# EasyEDA Pro project ProPrj_小车整板_2026-04-26.epro

# Schematic Schematic1
Board Name: Board1; Create Date: 2025-11-21; Page Name: P1; Project Name: 小车整板; Schematic Name: Schematic1; Update Date: 2025-11-21; BladeWidth: 10; Company: 嘉立创EDA; Page Size: A4; RegionStart: 1; ShowBorder: 1; TitleBlock: 1; TitleBlockPosition: 3; Version: V1.0; XRegionCount: 6; YRegionCount: 4
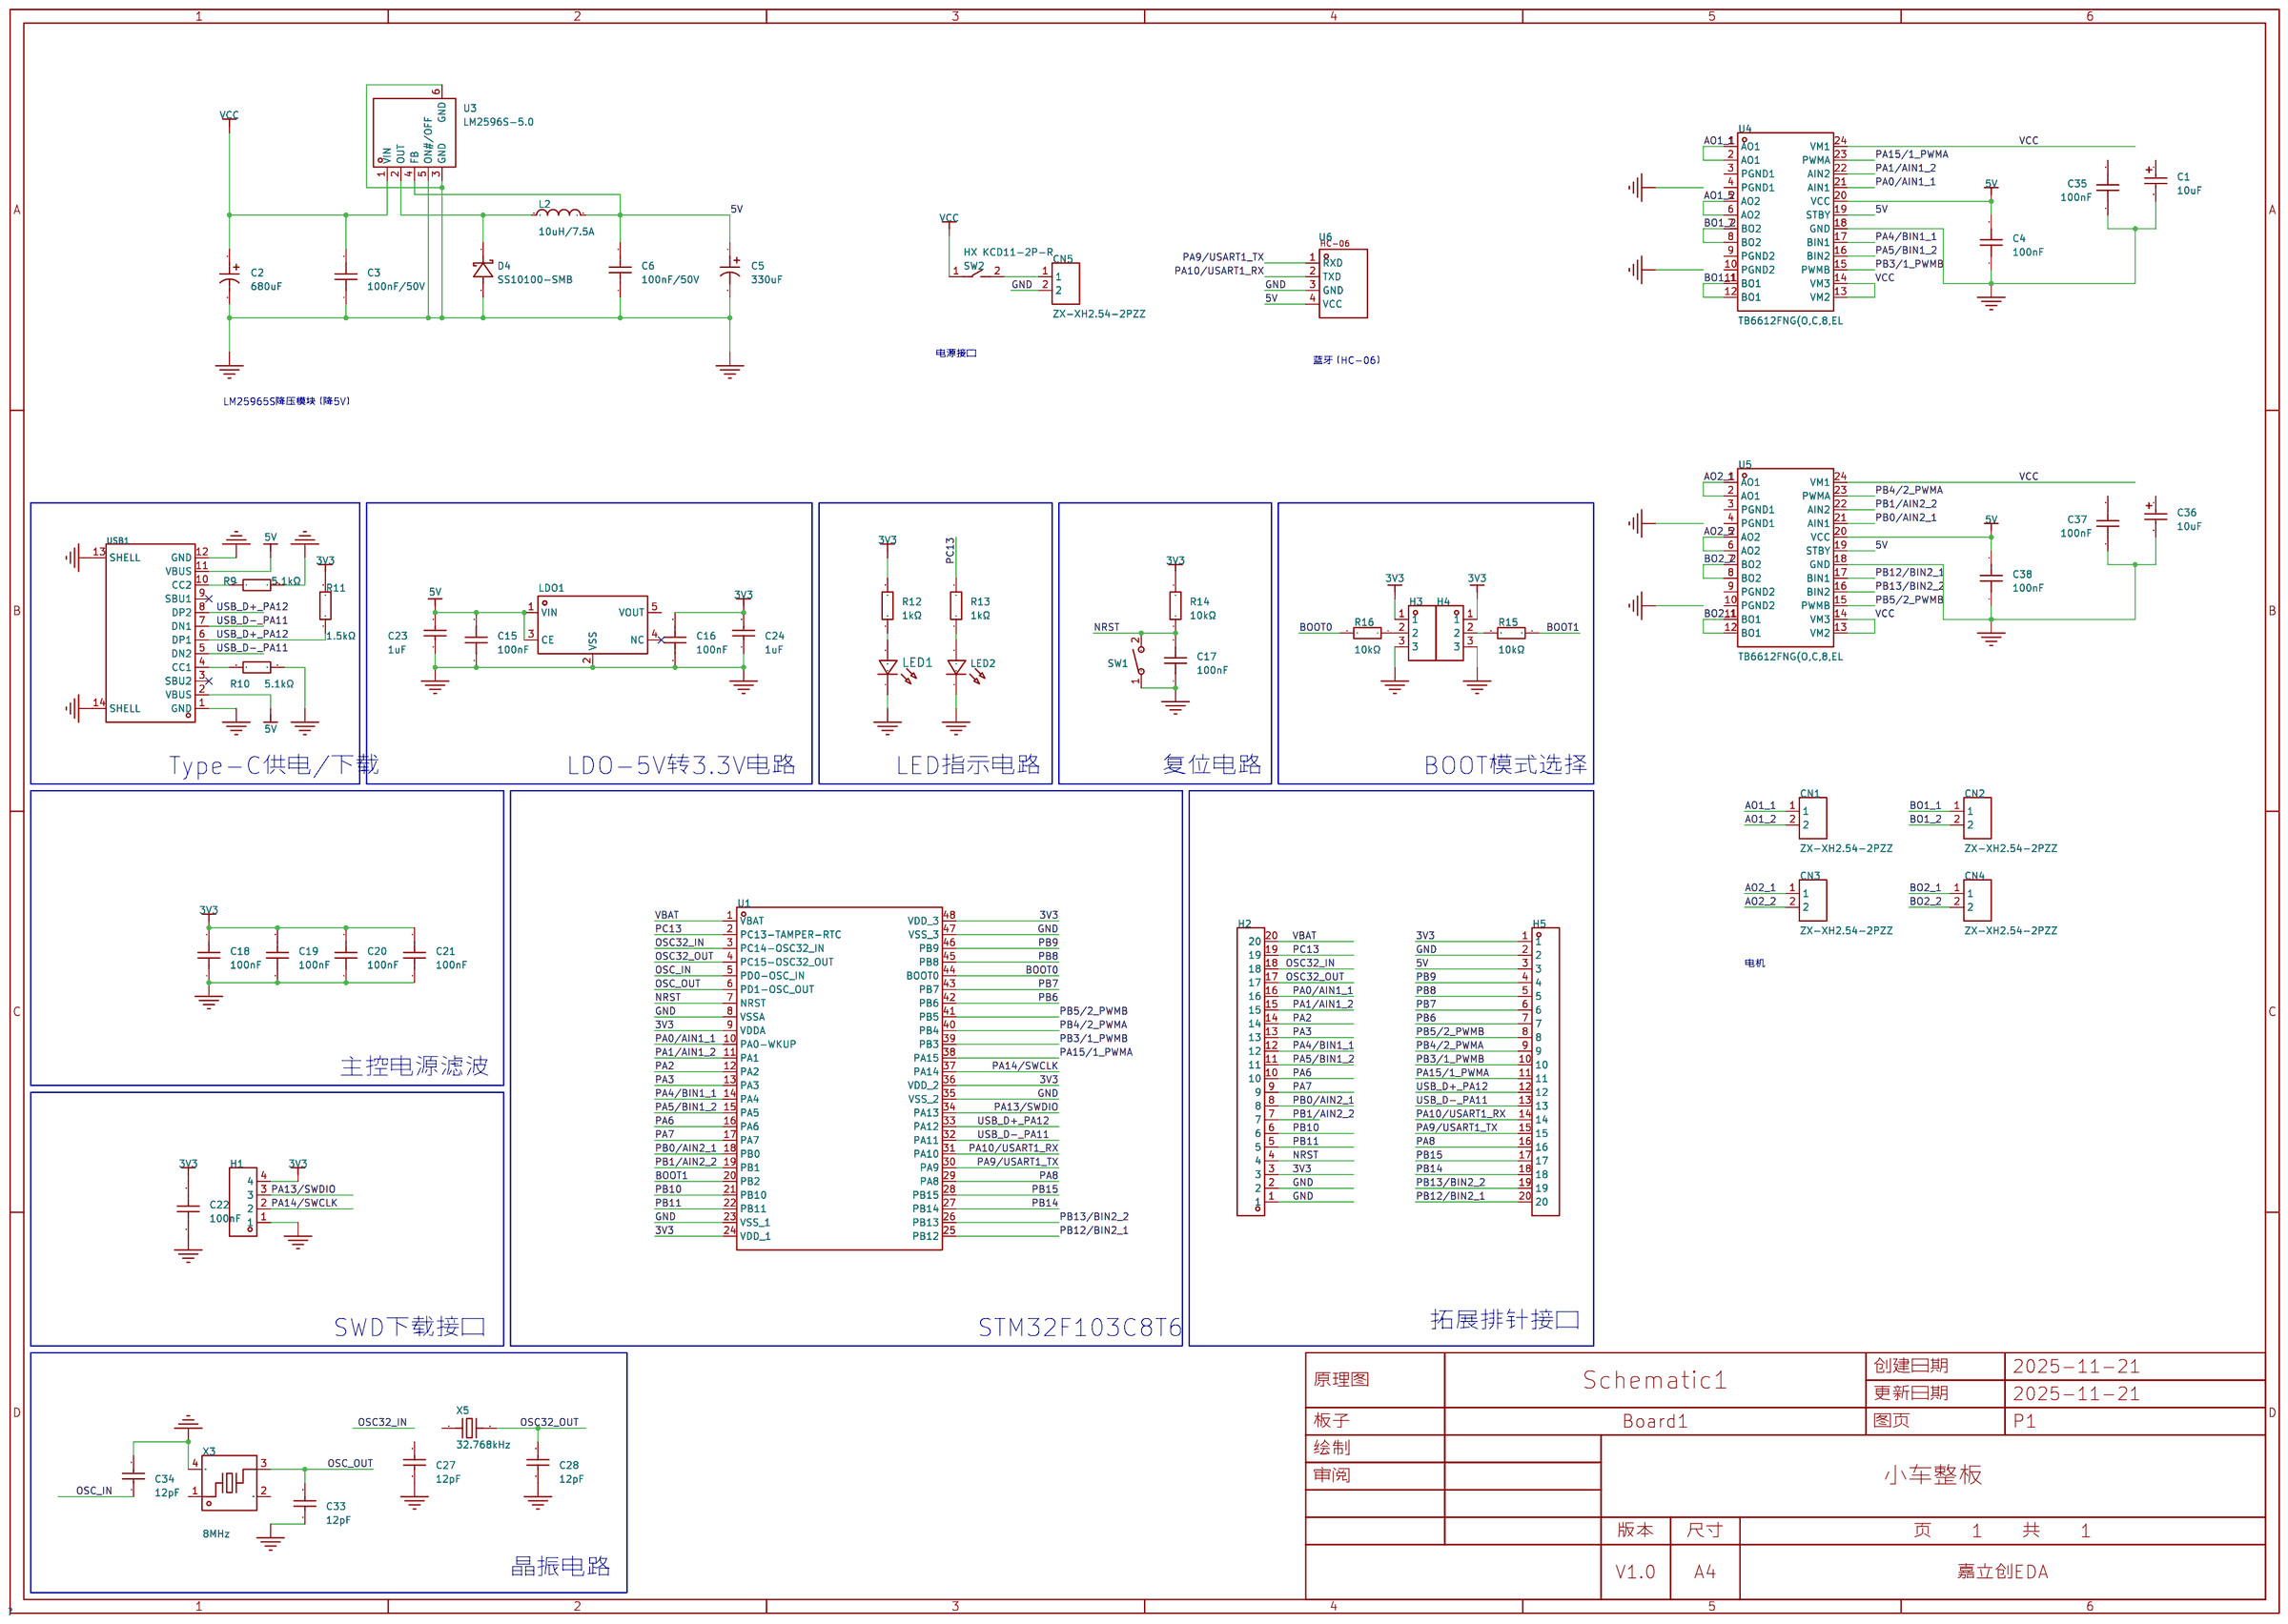
[diagram p0: schematic sheet]

## Parts
C1  10uF  [CAP-SMD_L3.2-W1.6-RD-C7171]
C2  680uF  [CAP-TH_BD13.0-P5.00-D0.6-FD]
C3  100nF/50V  [C0805]
C4  100nF  [C0603]
C5  330uF  [CAP-TH_BD8.0-P3.50-D0.6-FD]
C6  100nF/50V  [C0805]
C15  100nF  [R0402]
C16  100nF  [R0402]
C17  100nF  [R0402]
C18  100nF  [R0402]
C19  100nF  [R0402]
C20  100nF  [R0402]
C21  100nF  [R0402]
C22  100nF  [R0402]
C23  1uF  [R0402]
C24  1uF  [R0402]
C27  12pF  [R0402]
C28  12pF  [R0402]
C33  12pF  [R0402]
C34  12pF  [R0402]
C35  100nF  [C0603]
C36  10uF  [CAP-SMD_L3.2-W1.6-RD-C7171]
C37  100nF  [C0603]
C38  100nF  [C0603]
CN1  ZX-XH2.54-2PZZ  [CONN-TH_2P-P2.50_HX25003-2A]
CN2  ZX-XH2.54-2PZZ  [CONN-TH_2P-P2.50_HX25003-2A]
CN3  ZX-XH2.54-2PZZ  [CONN-TH_2P-P2.50_HX25003-2A]
CN4  ZX-XH2.54-2PZZ  [CONN-TH_2P-P2.50_HX25003-2A]
CN5  ZX-XH2.54-2PZZ  [CONN-TH_2P-P2.50_HX25003-2A]
D4  SS10100-SMB  [SMB_L4.6-W3.6-LS5.3-RD]
H1  -  [HDR-TH_4P-P2.54-V-M]
H2  -  [HDR-TH_20P-P2.54-V-M-1]
H3  -  [HDR-TH_3P-P2.54-V-M]
H4  -  [HDR-TH_3P-P2.54-V-M]
H5  -  [HDR-TH_20P-P2.54-V-M-1]
L2  10uH/7.5A  [IND-SMD_L11.0-W10.2]
LDO1  ME6211C33M5G-N  [SOT-23-5_L3.0-W1.7-P0.95-LS2.8-BL]
LED1  -  [LED_0603]
LED2  -  [LED_0603]
R9  5.1kΩ  [R0402]
R10  5.1kΩ  [R0402]
R11  1.5kΩ  [R0402]
R12  1kΩ  [R0402]
R13  1kΩ  [R0402]
R14  10kΩ  [R0402]
R15  10kΩ  [R0402]
R16  10kΩ  [R0402]
SW1  TS-1101-B-W  [KEY-SMD_2P-L6.0-W3.6-P7.4-LS8.0-L]
SW2  HX KCD11-2P-R  [SW-TH_2P-L15.0-W10.5-P5.00_KCD11-2P-R]
U1  STM32F103C8T6  [LQFP-48_L7.0-W7.0-P0.50-LS9.0-BL]
U3  LM2596S-5.0  [TO-263-5_L10.1-W8.7-P1.70-LS15.2-BR]
U4  TB6612FNG(O,C,8,EL  [SSOP-24_L8.4-W5.8-P0.65-LS7.8-BL]
U5  TB6612FNG(O,C,8,EL  [SSOP-24_L8.4-W5.8-P0.65-LS7.8-BL]
U6  -  [HC-06]
USB1  TYPE-C 16PIN 2MD(073)  [USB-C-SMD_TYPE-C-6PIN-2MD-073]
X3  8MHz  [CRYSTAL-SMD_4P-L3.2-W2.5-BL-1]
X5  32.768kHz  [OSC-SMD_L3.2-W1.5]

## Library data of the parts
C1 C36 = TAJA106K016RNJ: 容值:10uF;精度:±10%;额定电压:16V;等效串联电阻(ESR):3Ω@100kHz;; LCSC Part Name: 10uF ±10% 16V; Supplier Part: C7171; Manufacturer: Kyocera AVX; Supplier Footprint: CASE-A-3216-18(mm); JLCPCB Part Class: 基础库; Supplier: LCSC; Tolerance: ±10%; Voltage Rating: 16V; Equivalent Series Resistance(ESR): 3Ω@100kHz; Operating Temperature: -55℃~+125℃
C2 = ERG50V680M13X21: 容值:680uF;精度:±20%;额定电压:50V;纹波电流:2.18A@100kHz;等效串联电阻(ESR):30mΩ@100kHz;; LCSC Part Name: 680uF ±20% 50V; Supplier Part: C48935384; Manufacturer: 捷而瑞; Supplier Footprint: 插件,D13xL21mm; JLCPCB Part Class: 扩展库; Datasheet: https://atta.szlcsc.com/upload/public/pdf/source/20250526/717B4C76834FE5C4A331D19A222D031C.pdf; Supplier: LCSC; Tolerance: ±20%; Voltage Rating: 50V; Ripple Current: 2.18A@100kHz; Equivalent Series Resistance(ESR): 30mΩ@100kHz; Pin Spacing: 5mm; Diameter: 13mm; Height - Seated (Max): 21mm; Lifetime: 2000hrs@105℃; Operating Temperature: -40℃~+105℃
C3 C6 = CAP_0805: Supplier Footprint: 0805
C4 C35 C37 C38 = CGA0603X7R104K500JT: 容值:100nF;精度:±10%;额定电压:50V;温度系数:X7R;; LCSC Part Name: 100nF ±10% 50V; Supplier Part: C6119867; Manufacturer: HRE(芯声); Supplier Footprint: 0603; JLCPCB Part Class: 扩展库; Datasheet: https://atta.szlcsc.com/upload/public/pdf/source/20250103/C44077DA9E7B3EFAE02F22B6D3D1CBC9.pdf; Supplier: LCSC; Tolerance: ±10%; Voltage Rating: 50V; Temperature Coefficient: X7R
C5 = ERG25V330M8X12: 容值:330uF;精度:±20%;额定电压:25V;纹波电流:760mA@100kHz;等效串联电阻(ESR):87mΩ@100kHz;; LCSC Part Name: 330uF ±20% 25V; Supplier Part: C47344178; Manufacturer: 捷而瑞; Supplier Footprint: 插件,D8xL12mm; JLCPCB Part Class: 扩展库; Datasheet: https://atta.szlcsc.com/upload/public/pdf/source/20250526/717B4C76834FE5C4A331D19A222D031C.pdf; Supplier: LCSC; Tolerance: ±20%; Voltage Rating: 25V; Ripple Current: 760mA@100kHz; Equivalent Series Resistance(ESR): 87mΩ@100kHz; Pin Spacing: 3.5mm; Diameter: 8mm; Height - Seated (Max): 12mm; Lifetime: 2000hrs@105℃; Operating Temperature: -40℃~+105℃
C15-C22 = GRM155R71H104KE14D: LCSC Part Name: 100nF ±10% 50V; Supplier Part: C77020; Manufacturer: muRata(村田); Supplier Footprint: 0402; JLCPCB Part Class: 扩展库; Datasheet: https://atta.szlcsc.com/upload/public/pdf/source/20180326/C77020_39BD49C951FF1AF0DB1F1FAC5AC1E401.pdf; Supplier: LCSC; Tolerance: ±10%; Voltage Rated: 50V; Temperature Coefficient: X7R
C23 C24 = CL05A105KP5NNNC: LCSC Part Name: 1uF ±10% 10V; Supplier Part: C14445; Manufacturer: SAMSUNG(三星); Supplier Footprint: 0402; JLCPCB Part Class: 扩展库; Datasheet: https://atta.szlcsc.com/upload/public/pdf/source/20160218/1457707763339.pdf; Supplier: LCSC; Tolerance: ±10%; Voltage Rated: 10V; Temperature Coefficient: X5R
C27 C28 C33 C34 = 0402CG120J500NT: LCSC Part Name: 12pF ±5% 50V; Supplier Part: C1547; Manufacturer: FH(风华); Supplier Footprint: 0402; JLCPCB Part Class: 基础库; Datasheet: https://atta.szlcsc.com/upload/public/pdf/source/20200305/C486355_26A10D38EF8C2A5C37091D0039909270.pdf; Supplier: LCSC; Tolerance: ±5%; Voltage Rated: 50V; Temperature Coefficient: C0G
CN1-CN5 = ZX-XH2.54-2PZZ: 插针结构:1x2P;间距:2.5mm;安装方式:直插;参考系列:XH;总PIN数:2P;排数:1;每排PIN数:2;行距:-;额定电流:2A;触头材质:黄铜;触头镀层:锡;工作温度:-25℃~+85℃;; LCSC Part Name: 1x2P 间距:2.5mm 直插 系列:XH; Supplier Part: C7429632; Manufacturer: Megastar(兆星); Supplier Footprint: 插件,P=2.5mm; JLCPCB Part Class: Extended Part; Datasheet: https://item.szlcsc.com/datasheet/ZX-XH2.54-2PZZ/8427549.html; Supplier: LCSC; Pins Structure: 1x2P; Pitch: 2.5mm; Mounting Type: 直插; Reference Series: XH; Number of Pins: 2P; Number of Rows: 1; Number of PINs Per Row: 2; Current Rating: 2A; Contact Material: 黄铜; Contact Plating: 锡; Operating Temperature: -25℃~+85℃; Voltage Rating: 250V; Plastic Material: PA66; Flame Retardant Rating: UL94V-0; Color: 白色; Z-Height of the Board: 7mm; X-Length of Bottom Edge on Board (Spacing Line): 7.5mm; Y-Width of Bottom Edge on Board: 5.9mm
D4 = SS10100-SMB: 二极管配置:独立式;正向压降(Vf):850mV@10A;直流反向耐压(Vr):100V;整流电流:10A;; LCSC Part Name: 电压:100V 电流:10A; Supplier Part: C908688; Manufacturer: GOODWORK(固得沃克); Supplier Footprint: SMB(DO-214AA); JLCPCB Part Class: 扩展库; Datasheet: https://item.szlcsc.com/datasheet/SS10100-SMB/975440.html; Supplier: LCSC; Diode Configuration: 独立式; Voltage - Forward(Vf@If): 850mV@10A; Voltage - DC Reverse(Vr): 100V; Current - Rectified: 10A; Reverse Leakage Current (Ir): 20nA; Operating Junction Temperature Range: -55℃~+150℃
H1 = HDR-M_2.54_1x4P: Supplier Part: C2935929; Supplier Footprint: 插件
H2 H5 = HDR-M_2.54_1x20P: Supplier Part: C50981; Supplier Footprint: 插件
H3 H4 = HDR-M_2.54_1x3P: Supplier Part: C2937625; Supplier Footprint: 插件
L2 = SL1040-100M: 电感值:10uH;精度:±20%;额定电流:7.5A;饱和电流(Isat):8A;; LCSC Part Name: 10uH ±20% 8A; Supplier Part: C22463839; Manufacturer: 台湾陆海; Supplier Footprint: SMD,11x10.5mm; JLCPCB Part Class: 扩展库; Datasheet: https://atta.szlcsc.com/upload/public/pdf/source/20240611/8DE7D6BE1273F2E871C82A6D5C20B08D.pdf; Supplier: LCSC; Tolerance: ±20%; Current Rating: 7.5A; Current - Saturation (Isat): 8A
LDO1 = ME6211C33M5G-N: Supplier Part: C82942; Manufacturer: MICRONE(南京微盟); Supplier Footprint: SOT-23-5; JLCPCB Part Class: 扩展库; Datasheet: https://atta.szlcsc.com/upload/public/pdf/source/20170918/C82942_1505727073070976520.pdf; Supplier: LCSC; Output Type: 固定; Output Polarity: 正; Number of Outputs: 1; Maximum Input Voltage: 6V; Output Voltage: 3.3V; Dropout Voltage: 260mV@(200mA); Output Current: 500mA; Power Supply Rejection Ratio (PSRR): 70dB
LED1 = LED_0603-R: Supplier Footprint: 0603; Supplier Part: C84263
LED2 = LED_0603-B: Supplier Footprint: 0603; Supplier Part: C84266
R9 R10 = 0402WGF5101TCE: LCSC Part Name: 5.1kΩ ±1% 62.5mW 厚膜电阻; Supplier Part: C25905; Manufacturer: UNI-ROYAL(厚声); Supplier Footprint: 0402; JLCPCB Part Class: 基础库; Datasheet: https://atta.szlcsc.com/upload/public/pdf/source/20200306/C422600_1E6D84923E4A46A82E41ADD87F860B5C.pdf; Supplier: LCSC; Type: 厚膜电阻; Tolerance: ±1%; Power(Watts): 62.5mW; Overload Voltage (Max): 50V; Temperature Coefficient: ±100ppm/℃; Operating Temperature Range: -55℃~+155℃
R11 = 0402WGF1501TCE: LCSC Part Name: 1.5kΩ ±1% 62.5mW 厚膜电阻; Supplier Part: C25867; Manufacturer: UNI-ROYAL(厚声); Supplier Footprint: 0402; JLCPCB Part Class: 基础库; Datasheet: https://atta.szlcsc.com/upload/public/pdf/source/20200306/C422600_1E6D84923E4A46A82E41ADD87F860B5C.pdf; Supplier: LCSC; Type: 厚膜电阻; Tolerance: ±1%; Power(Watts): 62.5mW; Overload Voltage (Max): 50V; Temperature Coefficient: ±100ppm/℃; Operating Temperature Range: -55℃~+155℃
R12 R13 = 0402WGF1001TCE: LCSC Part Name: 1kΩ ±1% 62.5mW 厚膜电阻; Supplier Part: C11702; Manufacturer: UNI-ROYAL(厚声); Supplier Footprint: 0402; JLCPCB Part Class: 基础库; Datasheet: https://atta.szlcsc.com/upload/public/pdf/source/20200306/C422600_1E6D84923E4A46A82E41ADD87F860B5C.pdf; Supplier: LCSC; Type: 厚膜电阻; Tolerance: ±1%; Power(Watts): 62.5mW; Overload Voltage (Max): 50V; Temperature Coefficient: ±100ppm/℃; Operating Temperature Range: -55℃~+155℃
R14-R16 = RC0402FR-0710KL: LCSC Part Name: 厚膜电阻 10kΩ ±1% 62.5mW; Supplier Part: C60490; Manufacturer: YAGEO(国巨); Supplier Footprint: 0402; JLCPCB Part Class: 扩展库; Datasheet: https://atta.szlcsc.com/upload/public/pdf/source/20170925/C131467_1506321478108990263.pdf; Supplier: LCSC; Type: 厚膜电阻; Tolerance: ±1%; Power(Watts): 62.5mW; Overload Voltage (Max): 50V; Temperature Coefficient: ±100ppm/℃; Operating Temperature Range: -55℃~+155℃
SW1 = TS-1101-B-W_C500065: LCSC Part Name: 6*3.6*2.5mm 立贴 轻触开关; Supplier Part: C500065; Manufacturer: XKB Connectivity(中国星坤); Supplier Footprint: SMD; JLCPCB Part Class: 扩展库; Datasheet: https://atta.szlcsc.com/upload/public/pdf/source/20211011/D0E0CAF534F7B19DDE4CE68748A25BD3.pdf; Supplier: LCSC; Contact Current: 50mA; Voltage Rating (DC): 12V; Circuit: 单刀单掷; Mounting Style: 立贴; Actuator Style: 矩形按钮; Actuator/Cap Color: 白色; With Lamp: 无; Operating Force: 160gf; Mechanical Life: 5万次; Operating Temperature: -30℃~+85℃; Switch Length: 6mm; Switch Width: 3.6mm; Switch Height: 2.5mm; Strike Gundam: 否
SW2 = HX KCD11-2P-R: 带灯:无;引脚样式:焊片;额定电流:3A;额定电压(AC):250V;电路结构:单刀单掷;工作寿命:1万次;; LCSC Part Name: 10.5*15mm 两脚两档跷板开关 红钮; Supplier Part: C6917318; Manufacturer: hanxia(韩下); Supplier Footprint: 插件; JLCPCB Part Class: 扩展库; Datasheet: https://atta.szlcsc.com/upload/public/pdf/source/20230526/CAA555F1CB670B015E4FF3F7F6A5662A.pdf; Supplier: LCSC; With Lamp: 无; Termination Style: 焊片; Actuator Color: 红色; Current Rating: 3A; Voltage Rating (AC): 250V; Circuit: 单刀单掷; Life: 1万次
U1 = STM32F103C8T6: LCSC Part Name: STM32F103C8T6 MSL=3; Supplier Part: C8734; Manufacturer: ST(意法半导体); Supplier Footprint: LQFP-48(7x7); JLCPCB Part Class: 扩展库; Datasheet: https://atta.szlcsc.com/upload/public/pdf/source/20220812/8363ACEC51AD55ECEB84799464F7CB85.pdf; Supplier: LCSC; CPU Core: CM3; Program Storage Size: 64KB; RAM Size: 20KB; GPIO Ports Number: 37; Operating Voltage Range: 2V~3.6V; CPU Maximum Speed: 72MHz; Program Memory Type: FLASH; Operating Temperature Range: -40℃~+85℃; ADC (Bit): 12bit; Universal Serial Bus: 有; Peripheral/Function: 看门狗；DMA；看门狗；片载温度传感器; Watchdog: 有; Infrared Data Association: 有; Low-Voltage Detect: 有; Direct Memory Access: 有; Internal Oscillator: 有
U3 = LM2596S-5.0_C5276750: 功能类型:降压型;输出类型:固定;工作电压:-;输出电压:5V;输出电流:-;; LCSC Part Name: 3A降压电压调节器; Supplier Part: C5276750; Manufacturer: TWGMC(台湾迪嘉); Supplier Footprint: TO-263-5; JLCPCB Part Class: 扩展库; Datasheet: https://atta.szlcsc.com/upload/public/pdf/source/20221121/BE66229392871E6008E3503EDFD620B9.pdf; Supplier: LCSC; Function: 降压型; Output Type: 固定; Output Voltage: 5V; Switching Frequency: 150kHz; Operating Temperature: -40℃~+125℃; Number of Outputs: 1; Topology: 降压式
U4 U5 = TB6612FNG(O,C,8,EL: 双直流电机驱动器集成电路; Supplier Part: C88224; Manufacturer: TOSHIBA(东芝); Supplier Footprint: SSOP-24-208mil; JLCPCB Part Class: 扩展库; Datasheet: https://item.szlcsc.com/datasheet/TB6612FNG(O%252CC%252C8%252CEL/89402.html; Supplier: LCSC; RDS(on): 500mΩ; Peak Current: 3.2A; Operating Temperature: -20℃~+85℃
U6 = HC-06: 蓝牙模块-4P; _: 3
USB1 = TYPE-C 16PIN 2MD(073): LCSC Part Name: TYPE-C母座 16P 4脚插件带定位柱 不锈钢外壳 2次模顶; Supplier Part: C2765186; Manufacturer: SHOU HAN(首韩); Supplier Footprint: SMD; JLCPCB Part Class: 扩展库; Supplier: LCSC; Connector Type: Type-C; Gender: 母座; Number of Contacts: 16; Number of Ports: 1; Mounting Style: 卧贴; Current Rating - Power (Max): 5A; Operating Temperature Range: -25℃~+85℃
X3 = XL2EL89COI-111YLC-8M: LCSC Part Name: 8MHz ±10ppm 12pF; Supplier Part: C2973805; Manufacturer: YXC(扬兴晶振); Supplier Footprint: SMD3225-4P; JLCPCB Part Class: 扩展库; Datasheet: https://atta.szlcsc.com/upload/public/pdf/source/20240329/19D5F850207469550BEB00D7DFEDBC7A.pdf; Supplier: LCSC; Crystal Type: 贴片晶振; Normal temperature Frequency Tolerance: ±10ppm; External load capacitor: 12pF; Frequency Stability(Full temperature range): ±20ppm; Equivalent Series Resistance (ESR): 150Ω; Operating Temperature: -40℃~+85℃
X5 = X321532768KGD2SI: LCSC Part Name: 32.768kHz ±20ppm 12.5pF; Supplier Part: C620155; Manufacturer: YXC(扬兴晶振); Supplier Footprint: SMD3215-2P; JLCPCB Part Class: 扩展库; Datasheet: https://atta.szlcsc.com/upload/public/pdf/source/20240329/3A7650FD985DD0DE85694D3785AB4916.pdf; Supplier: LCSC; Crystal Type: 贴片晶振; Normal temperature Frequency Tolerance: ±20ppm; External load capacitor: 12.5pF; Operating Temperature: -40℃~+85℃

## Nets
3V3: C16.2 C18.2 C19.2 C20.2 C21.2 C22.2 C24.2 H1.4 H2.3 H3.1 H4.1 H5.1 LDO1.5(VOUT) R11.2 R12.2 R14.2 U1.9(VDDA) U1.24(VDD_1) U1.36(VDD_2) U1.48(VDD_3)
5V: C4.2 C5.1 C6.2 C15.2 C23.2 C38.2 H5.3 L2.2 LDO1.1(VIN) LDO1.3(CE) U3.4(FB) U4.19(STBY) U4.20(VCC) U5.19(STBY) U5.20(VCC) U6.4(VCC) USB1.2(VBUS) USB1.11(VBUS)
GND: C1.2 C2.2 C3.1 C4.1 C5.2 C6.1 C15.1 C16.1 C17.1 C18.1 C19.1 C20.1 C21.1 C22.1 C23.1 C24.1 C27.1 C28.1 C33.1 C34.2 C35.1 C36.2 C37.1 C38.1 CN5.2 D4.2(A) H1.1 H2.1 H2.2 H3.3 H4.3 H5.2 LDO1.2(VSS) LED1.1(C) LED2.1(C) R9.2 R10.2 SW1.1 U1.8(VSSA) U1.23(VSS_1) U1.35(VSS_2) U1.47(VSS_3) U3.3(GND) U3.5(ON#/OFF) U3.6(GND) U4.3(PGND1) U4.4(PGND1) U4.9(PGND2) U4.10(PGND2) U4.18(GND) U5.3(PGND1) U5.4(PGND1) U5.9(PGND2) U5.10(PGND2) U5.18(GND) U6.3(GND) USB1.1(GND) USB1.12(GND) USB1.13(SHELL) USB1.14(SHELL) X3.2(GND) X3.4(GND)
VBAT: H2.20 U1.1(VBAT)
VCC: C1.1 C2.1 C3.2 C35.2 C36.1 C37.2 SW2.1 U3.1(VIN) U4.13(VM2) U4.14(VM3) U4.24(VM1) U5.13(VM2) U5.14(VM3) U5.24(VM1)
AO1_1: CN1.1 U4.1(AO1) U4.2(AO1)
AO1_2: CN1.2 U4.5(AO2) U4.6(AO2)
AO2_1: CN3.1 U5.1(AO1) U5.2(AO1)
AO2_2: CN3.2 U5.5(AO2) U5.6(AO2)
BO1_1: CN2.1 U4.11(BO1) U4.12(BO1)
BO1_2: CN2.2 U4.7(BO2) U4.8(BO2)
BO2_1: CN4.1 U5.11(BO1) U5.12(BO1)
BO2_2: CN4.2 U5.7(BO2) U5.8(BO2)
BOOT0: R16.2 U1.44(BOOT0)
BOOT1: R15.1 U1.20(PB2)
NRST: C17.2 H2.4 R14.1 SW1.2 U1.7(NRST)
OSC32_IN: C27.2 H2.18 U1.3(PC14-OSC32_IN) X5.1
OSC32_OUT: C28.2 H2.17 U1.4(PC15-OSC32_OUT) X5.2
OSC_IN: C34.1 U1.5(PD0-OSC_IN) X3.1
OSC_OUT: C33.2 U1.6(PD1-OSC_OUT) X3.3
PA0/AIN1_1: H2.16 U1.10(PA0-WKUP) U4.21(AIN1)
PA1/AIN1_2: H2.15 U1.11(PA1) U4.22(AIN2)
PA2: H2.14 U1.12(PA2)
PA3: H2.13 U1.13(PA3)
PA4/BIN1_1: H2.12 U1.14(PA4) U4.17(BIN1)
PA5/BIN1_2: H2.11 U1.15(PA5) U4.16(BIN2)
PA6: H2.10 U1.16(PA6)
PA7: H2.9 U1.17(PA7)
PA8: H5.16 U1.29(PA8)
PA9/USART1_TX: H5.15 U1.30(PA9) U6.1(RXD)
PA10/USART1_RX: H5.14 U1.31(PA10) U6.2(TXD)
PA13/SWDIO: H1.3 U1.34(PA13)
PA14/SWCLK: H1.2 U1.37(PA14)
PA15/1_PWMA: H5.11 U1.38(PA15) U4.23(PWMA)
PB0/AIN2_1: H2.8 U1.18(PB0) U5.21(AIN1)
PB1/AIN2_2: H2.7 U1.19(PB1) U5.22(AIN2)
PB3/1_PWMB: H5.10 U1.39(PB3) U4.15(PWMB)
PB4/2_PWMA: H5.9 U1.40(PB4) U5.23(PWMA)
PB5/2_PWMB: H5.8 U1.41(PB5) U5.15(PWMB)
PB6: H5.7 U1.42(PB6)
PB7: H5.6 U1.43(PB7)
PB8: H5.5 U1.45(PB8)
PB9: H5.4 U1.46(PB9)
PB10: H2.6 U1.21(PB10)
PB11: H2.5 U1.22(PB11)
PB12/BIN2_1: H5.20 U1.25(PB12) U5.17(BIN1)
PB13/BIN2_2: H5.19 U1.26(PB13) U5.16(BIN2)
PB14: H5.18 U1.27(PB14)
PB15: H5.17 U1.28(PB15)
PC13: H2.19 R13.2 U1.2(PC13-TAMPER-RTC)
USB_D+_PA12: H5.12 R11.1 U1.33(PA12) USB1.6(DP1) USB1.8(DP2)
USB_D-_PA11: H5.13 U1.32(PA11) USB1.5(DN2) USB1.7(DN1)
$1N1914: R10.1 USB1.4(CC1)
$1N1923: R9.1 USB1.10(CC2)
$1N1934: LED1.2(A) R12.1
$1N1936: LED2.2(A) R13.1
$1N1947: H3.2 R16.1
$1N2133: H4.2 R15.2
$1N2477: D4.1(C) L2.1 U3.2(OUT)
$1N2684: CN5.1 SW2.2

Not connected (* = marked no-connect by the designer): LDO1 4(NC)*; USB1 3(SBU2)* 9(SBU1)*

## Notes on the sheet
- 电源接口
- 蓝牙（HC-06）
- LM25965S降压模块（降5V）
- Type-C供电/下载
- LDO-5V转3.3V电路
- LED指示电路
- 复位电路
- BOOT模式选择
- 电机
- 主控电源滤波
- SWD下载接口
- STM32F103C8T6
- 拓展排针接口
- 晶振电路

# Board PCB1
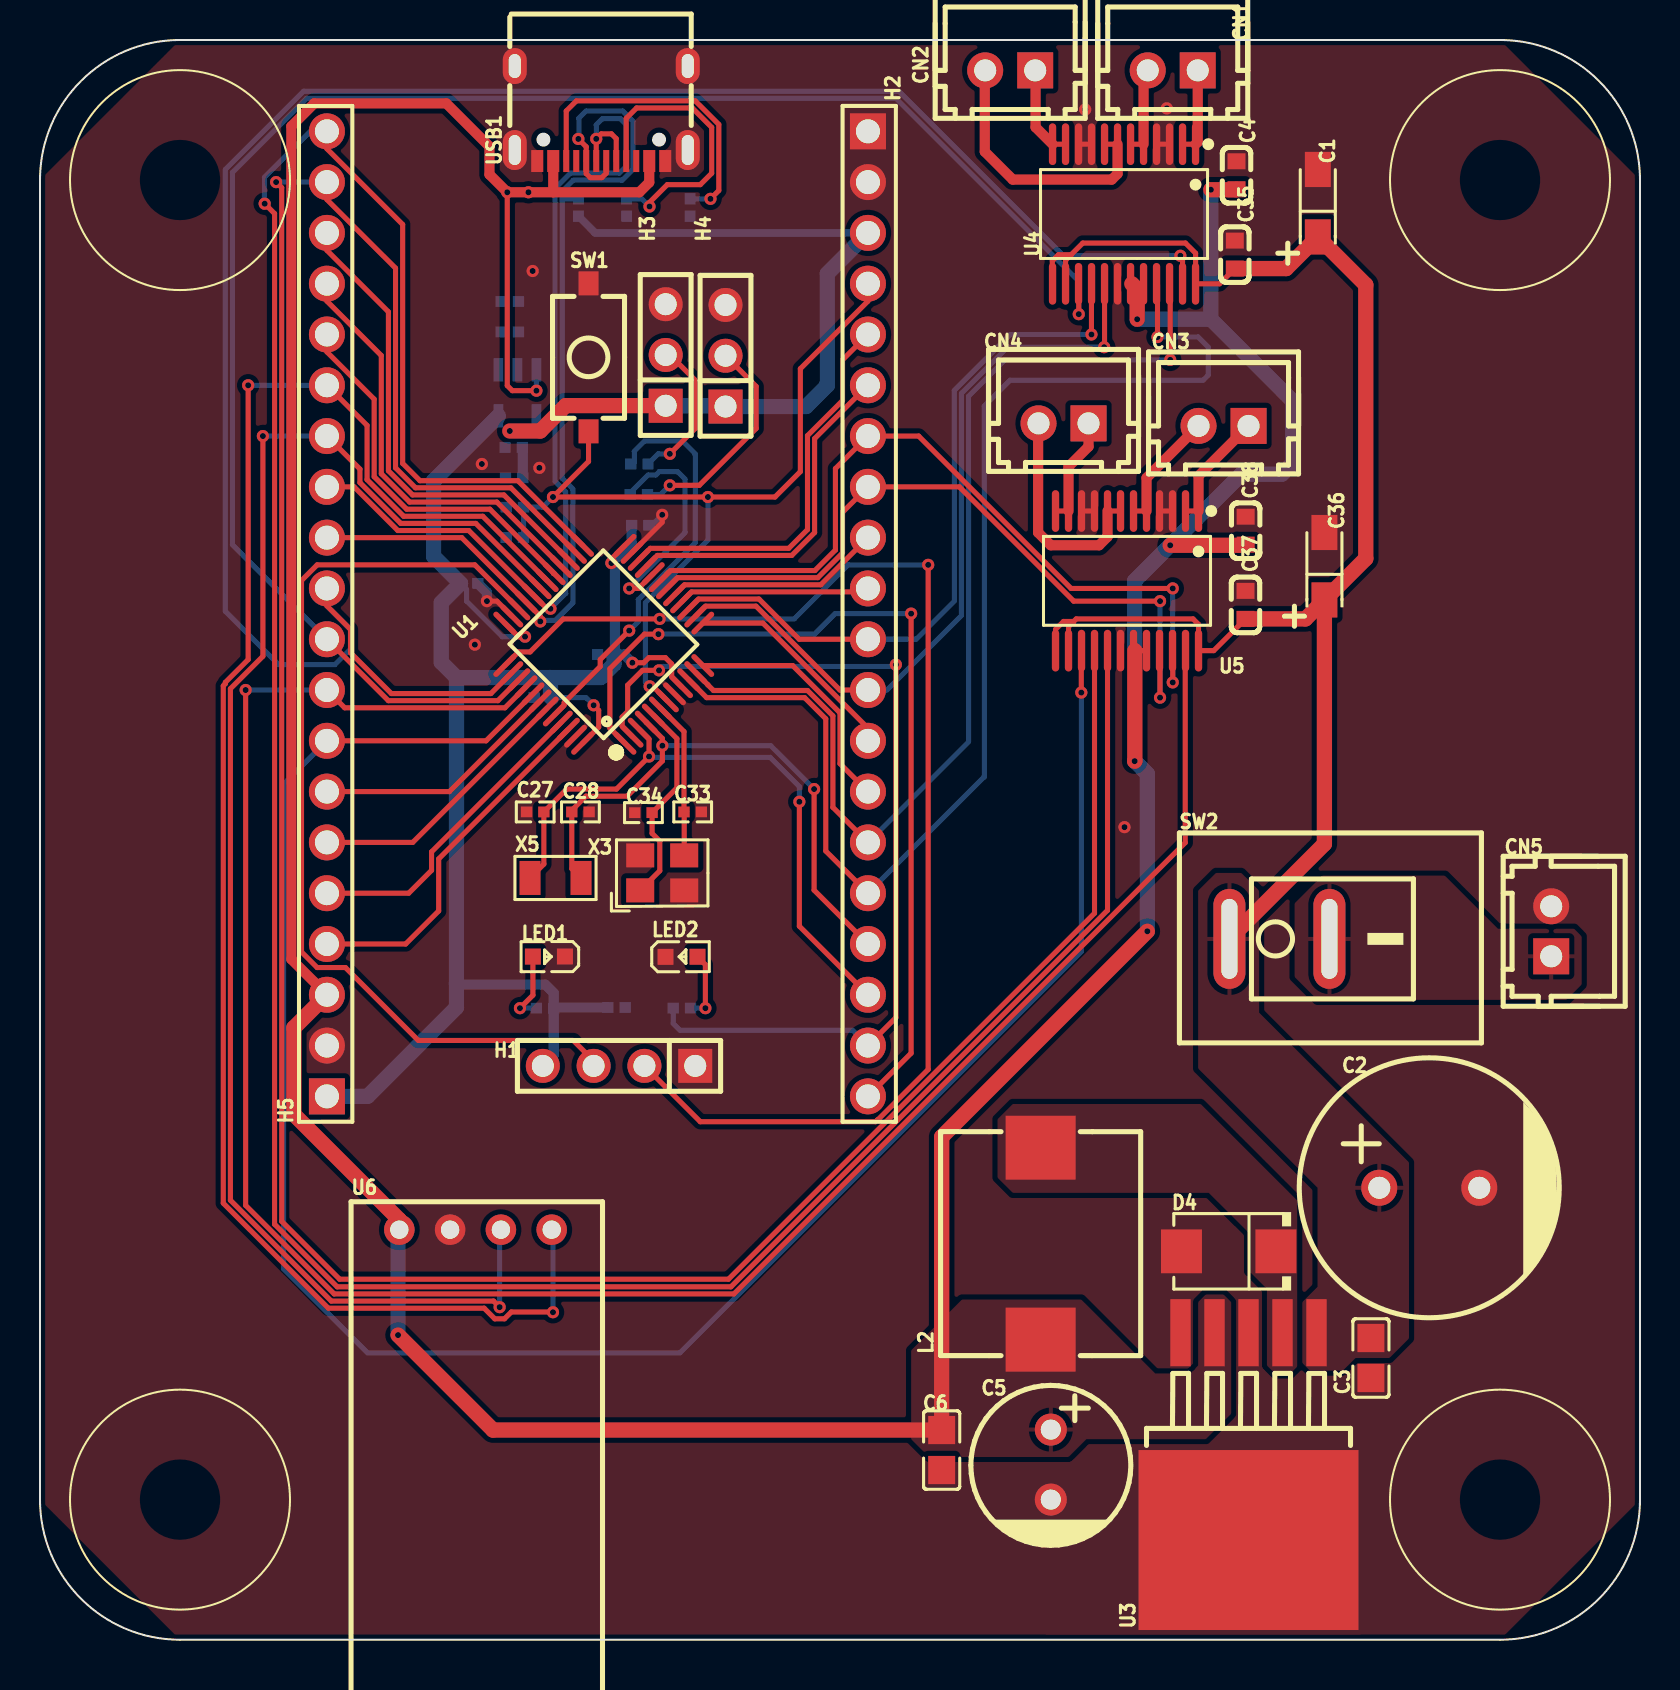
[diagram p1: board, top side]
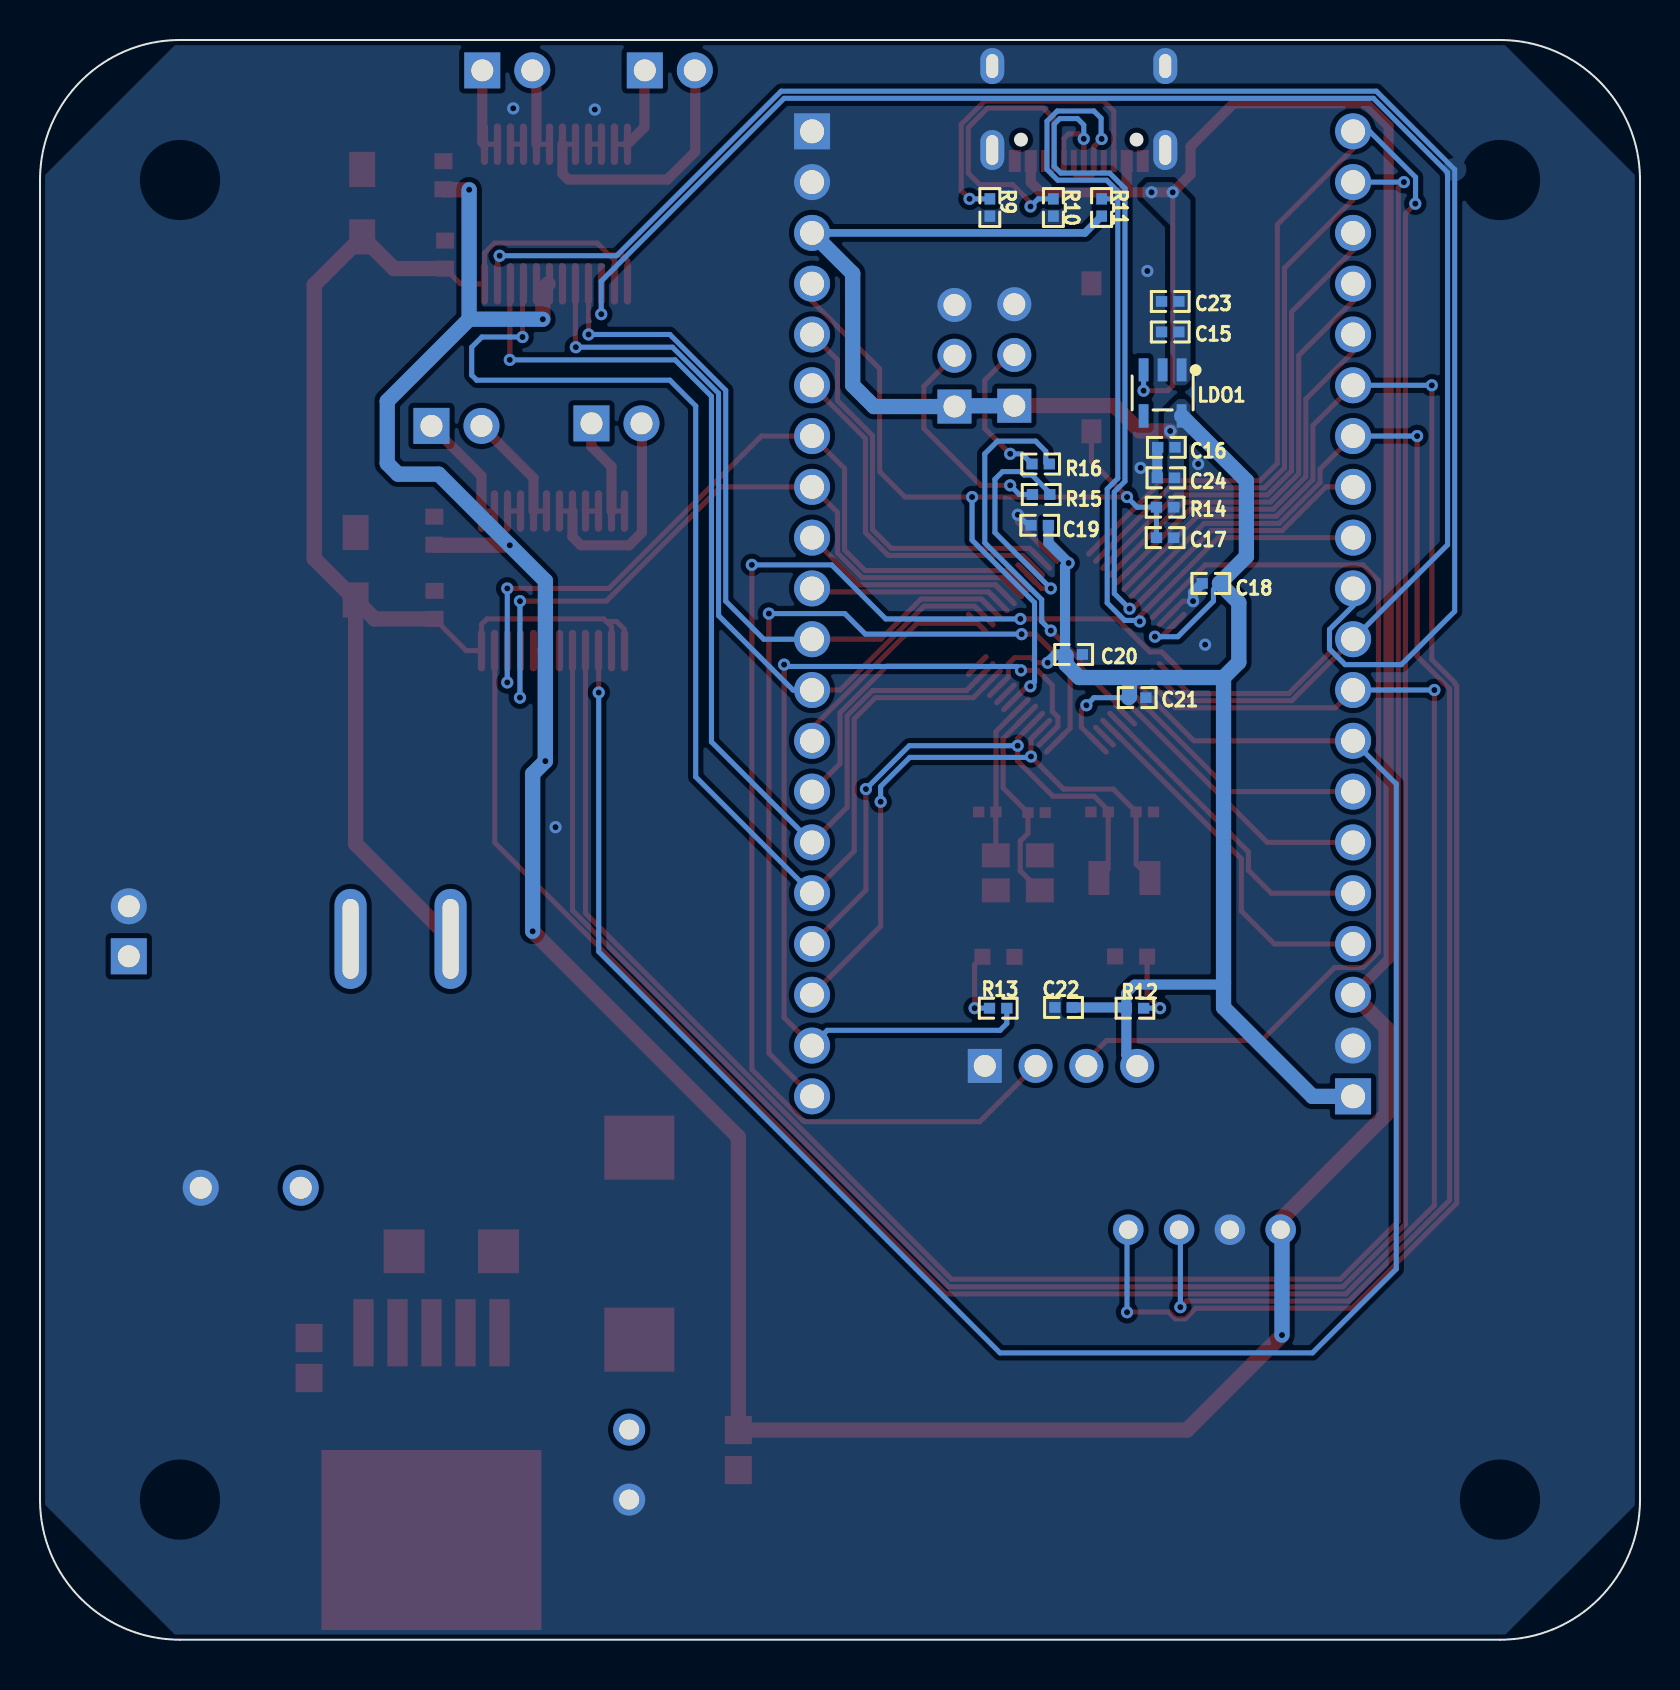
[diagram p2: board, bottom side, seen from below]

Outline 80 x 80 mm; copper layers: Top Layer, Bottom Layer. Coordinates in mm from the lower left corner of the outline.
Outline path: 0,73 arc(2.05,77.95) 7,80 73,80 arc(77.95,77.95) 80,73 80,7 arc(77.95,2.05) 73,0 7,0 arc(2.05,2.05) 0,7 0,73
Stack: Top Layer 0.035mm / Dielectric1 1.51mm FR4 er 4.5 / Bottom Layer 0.035mm

## Design rules (mm)
spacing copperThickness1oz (default): track to track 0.102, other pairs 0.152 to 0.3
spacing copperThickness2oz: track to track 0.203, other pairs 0.152 to 0.3
spacing Plane_innerPlane: track to track 0.102, other pairs 0.152 to 0.3
spacing Copper_copperRegion: track to track 0.102, other pairs 0.152 to 0.3
spacing Copper_copperRegion-gnd: track to track 0.102, other pairs 0.152 to 0.3
spacing Copper_copperRegion1: track to track 0.102, other pairs 0.152 to 0.3
track width copperThickness1oz (default): min 0.127, default 0.254, max 2.54
track width copperThickness2oz: min 0.203, default 0.254, max 2.54
differential pair differentialPair (default): width min 0.127, default 0.254, max 2.54; gap min 0.152, default 0.152
net VCC uses copperRegion1
net GND uses copperRegion-gnd
net 5V uses copperRegion1
net 3V3 uses copperRegion1
net $1N2477 uses copperRegion1
pour e734 uses Copper_copperRegion-gnd, copperRegion_Copper_copperRegion-gnd
pour e742 uses Copper_copperRegion-gnd, copperRegion_Copper_copperRegion-gnd
pour e746 uses Copper_copperRegion1, copperRegion_Copper_copperRegion1
pour e748 uses Copper_copperRegion1, copperRegion_Copper_copperRegion1
pour e750 uses Copper_copperRegion-gnd, copperRegion_Copper_copperRegion-gnd
pour e752 uses Copper_copperRegion1, copperRegion_Copper_copperRegion1
pour e758 uses Copper_copperRegion1, copperRegion_Copper_copperRegion1
pour e768 uses Copper_copperRegion1, copperRegion_Copper_copperRegion1
pour e770 uses Copper_copperRegion, copperRegion_Copper_copperRegion
pour e779 uses Copper_copperRegion-gnd, copperRegion_Copper_copperRegion-gnd
pour e781 uses Copper_copperRegion-gnd, copperRegion_Copper_copperRegion-gnd
pour e783 uses Copper_copperRegion-gnd, copperRegion_Copper_copperRegion-gnd

## Placement (name value [footprint] x y rotation side)
C1  10uF  [CAP-SMD_L3.2-W1.6-RD-C7171]  63.89 71.84 90 top
C2  680uF  [CAP-TH_BD13.0-P5.00-D0.6-FD]  69.46 22.6 0 top
C3  100nF/50V  [C0805]  66.55 14.09 90 top
C4  100nF  [C0603]  59.83 73.24 270 top
C5  330uF  [CAP-TH_BD8.0-P3.50-D0.6-FD]  50.54 8.76 270 top
C6  100nF/50V  [C0805]  45.08 9.49 90 top
C15  100nF  [R0402]  23.49 65.4 180 bottom
C16  100nF  [R0402]  23.68 59.63 180 bottom
C17  100nF  [R0402]  23.74 55.11 0 bottom
C18  100nF  [R0402]  21.46 52.83 180 bottom
C19  100nF  [R0402]  30.01 55.73 180 bottom
C20  100nF  [R0402]  28.32 49.27 0 bottom
C21  100nF  [R0402]  25.14 47.11 0 bottom
C22  100nF  [R0402]  28.82 31.62 180 bottom
C23  1uF  [R0402]  23.49 66.92 180 bottom
C24  1uF  [R0402]  23.7 58.1 180 bottom
C27  12pF  [R0402]  24.76 41.4 0 top
C28  12pF  [R0402]  27.02 41.4 180 top
C33  12pF  [R0402]  32.63 41.4 180 top
C34  12pF  [R0402]  30.17 41.36 180 top
C35  100nF  [C0603]  59.74 69.27 270 top
C36  10uF  [CAP-SMD_L3.2-W1.6-RD-C7171]  64.22 53.68 90 top
C37  100nF  [C0603]  60.28 51.75 270 top
C38  100nF  [C0603]  60.28 55.46 270 top
CN1  ZX-XH2.54-2PZZ  [CONN-TH_2P-P2.50_HX25003-2A]  56.64 78.48 180 top
CN2  ZX-XH2.54-2PZZ  [CONN-TH_2P-P2.50_HX25003-2A]  48.51 78.48 180 top
CN3  ZX-XH2.54-2PZZ  [CONN-TH_2P-P2.50_HX25003-2A]  59.18 60.7 180 top
CN4  ZX-XH2.54-2PZZ  [CONN-TH_2P-P2.50_HX25003-2A]  51.18 60.83 180 top
CN5  ZX-XH2.54-2PZZ  [CONN-TH_2P-P2.50_HX25003-2A]  75.56 35.43 90 top
D4  SS10100-SMB  [SMB_L4.6-W3.6-LS5.3-RD]  59.43 19.42 180 top
H1  -  [HDR-TH_4P-P2.54-V-M]  28.95 28.7 180 top
H2  -  [HDR-TH_20P-P2.54-V-M-1]  41.4 51.3 270 top
H3  -  [HDR-TH_3P-P2.54-V-M]  31.28 64.25 90 top
H4  -  [HDR-TH_3P-P2.54-V-M]  34.28 64.21 90 top
H5  -  [HDR-TH_20P-P2.54-V-M-1]  14.35 51.3 90 top
L2  10uH/7.5A  [IND-SMD_L11.0-W10.2]  50.03 19.81 270 top
LDO1  ME6211C33M5G-N  [SOT-23-5_L3.0-W1.7-P0.95-LS2.8-BL]  23.87 62.35 0 bottom
LED1  -  [LED_0603]  25.39 34.16 180 top
LED2  -  [LED_0603]  32.13 34.16 0 top
R9  5.1kΩ  [R0402]  32.51 71.62 270 bottom
R10  5.1kΩ  [R0402]  29.33 71.62 270 bottom
R11  1.5kΩ  [R0402]  26.92 71.62 270 bottom
R12  1kΩ  [R0402]  25.25 31.58 0 bottom
R13  1kΩ  [R0402]  32.09 31.58 180 bottom
R14  10kΩ  [R0402]  23.74 56.64 180 bottom
R15  10kΩ  [R0402]  29.94 57.27 0 bottom
R16  10kΩ  [R0402]  29.97 58.8 180 bottom
SW1  TS-1101-B-W  [KEY-SMD_2P-L6.0-W3.6-P7.4-LS8.0-L]  27.43 64.13 270 top
SW2  HX KCD11-2P-R  [SW-TH_2P-L15.0-W10.5-P5.00_KCD11-2P-R]  61.97 35.05 0 top
U1  STM32F103C8T6  [LQFP-48_L7.0-W7.0-P0.50-LS9.0-BL]  28.19 49.78 45 top
U3  LM2596S-5.0  [TO-263-5_L10.1-W8.7-P1.70-LS15.2-BR]  60.43 10.17 90 top
U4  TB6612FNG(O,C,8,EL  [SSOP-24_L8.4-W5.8-P0.65-LS7.8-BL]  54.2 71.3 180 top
U5  TB6612FNG(O,C,8,EL  [SSOP-24_L8.4-W5.8-P0.65-LS7.8-BL]  54.35 52.95 180 top
U6  -  [HC-06]  21.84 5.71 0 top
USB1  TYPE-C 16PIN 2MD(073)  [USB-C-SMD_TYPE-C-6PIN-2MD-073]  28.06 76.32 180 top
X3  8MHz  [CRYSTAL-SMD_4P-L3.2-W2.5-BL-1]  31.11 38.35 0 top
X5  32.768kHz  [OSC-SMD_L3.2-W1.5]  25.78 38.09 0 top

## Footprints (pads in the part's own frame, mm; a bottom-side part is the same pattern mirrored in y, then rotated)
C0603
  rect 0.8x0.9 smd: 1(-0.7,0) 2(0.7,0)
C0805
  rect 1.41x1.35 smd: 1(-1,0) 2(1,0)
CAP-SMD_L3.2-W1.6-RD-C7171
  rect 1.758x1.296 smd: 1(-1.687,0) 2(1.687,0)
CAP-TH_BD8.0-P3.50-D0.6-FD
  round 1.6 hole 1: 1(-1.75,0) 2(1.75,0)
CAP-TH_BD13.0-P5.00-D0.6-FD
  round 1.8 hole 1.1: 1(-2.5,0) 2(2.5,0)
CONN-TH_2P-P2.50_HX25003-2A
  rect 1.8x1.8 hole 1.1: 1(-1.25,0)
  round 1.8 hole 1.1: 2(1.25,0)
CRYSTAL-SMD_4P-L3.2-W2.5-BL-1
  rect 1.4x1.2 smd: 1(-1.1,-0.875) 2(1.1,-0.875) 3(1.1,0.875) 4(-1.1,0.875)
HC-06
  round 1.524 hole 0.914: 1(3.747,14.796) 2(1.206,14.796) 3(-1.333,14.796) 4(-3.873,14.796)
HDR-TH_3P-P2.54-V-M
  rect 1.7x1.7 hole 1.1: 1(-2.54,0)
  round 1.7 hole 1.1: 2(0,0) 3(2.54,0)
HDR-TH_4P-P2.54-V-M
  rect 1.7x1.7 hole 1.1: 1(-3.81,0)
  round 1.7 hole 1.1: 2(-1.27,0) 3(1.27,0) 4(3.81,0)
HDR-TH_20P-P2.54-V-M-1
  rect 1.8x1.8 hole 1.2: 1(-24.13,0)
  round 1.8 hole 1.2: 2(-21.59,0) 3(-19.05,0) 4(-16.51,0) 5(-13.97,0) 6(-11.43,0) 7(-8.89,0) 8(-6.35,0) 9(-3.81,0) 10(-1.27,0) 11(1.27,0) 12(3.81,0) 13(6.35,0) 14(8.89,0) 15(11.43,0) 16(13.97,0) 17(16.51,0) 18(19.05,0) 19(21.59,0) 20(24.13,0)
IND-SMD_L11.0-W10.2
  rect 3.2x3.5 smd: 1(-4.8,0) 2(4.8,0)
KEY-SMD_2P-L6.0-W3.6-P7.4-LS8.0-L
  rect 1.2x1 smd: 1(-3.7,0) 2(3.7,0)
LED_0603
  rect 0.8x0.8 smd: 1(-0.851,-0.01) 2(0.75,-0.005)
LQFP-48_L7.0-W7.0-P0.50-LS9.0-BL
  oval 0.27x1.5 smd: 1(-2.75,-4.25) 2(-2.25,-4.25) 3(-1.75,-4.25) 4(-1.25,-4.25) 5(-0.75,-4.25) 6(-0.25,-4.25) 7(0.25,-4.25) 8(0.75,-4.25) 9(1.25,-4.25) 10(1.75,-4.25) 11(2.25,-4.25) 12(2.75,-4.25) 25(2.75,4.25) 26(2.25,4.25) 27(1.75,4.25) 28(1.25,4.25) 29(0.75,4.25) 30(0.25,4.25) 31(-0.25,4.25) 32(-0.75,4.25) 33(-1.25,4.25) 34(-1.75,4.25) 35(-2.25,4.25) 36(-2.75,4.25)
  oval 1.5x0.27 smd: 13(4.25,-2.75) 14(4.25,-2.25) 15(4.25,-1.75) 16(4.25,-1.25) 17(4.25,-0.75) 18(4.25,-0.25) 19(4.25,0.25) 20(4.25,0.75) 21(4.25,1.25) 22(4.25,1.75) 23(4.25,2.25) 24(4.25,2.75) 37(-4.25,2.75) 38(-4.25,2.25) 39(-4.25,1.75) 40(-4.25,1.25) 41(-4.25,0.75) 42(-4.25,0.25) 43(-4.25,-0.25) 44(-4.25,-0.75) 45(-4.25,-1.25) 46(-4.25,-1.75) 47(-4.25,-2.25) 48(-4.25,-2.75)
OSC-SMD_L3.2-W1.5
  rect 1.05x1.7 smd: 1(-1.275,0) 2(1.275,0)
R0402
  rect 0.566x0.54 smd: 1(-0.433,0) 2(0.433,0)
SMB_L4.6-W3.6-LS5.3-RD
  rect 2.047x2.192 smd: 1(-2.361,0) 2(2.361,0)
SOT-23-5_L3.0-W1.7-P0.95-LS2.8-BL
  rect 0.49x1.157 smd: 1(-0.95,-1.153) 2(0,-1.153) 3(0.95,-1.153)
  rect 0.49x1.175 smd: 4(0.95,1.153) 5(-0.95,1.153)
SSOP-24_L8.4-W5.8-P0.65-LS7.8-BL
  oval 0.364x2.082 smd: 1(-3.575,-3.491) 2(-2.925,-3.491) 3(-2.275,-3.491) 4(-1.625,-3.491) 5(-0.975,-3.491) 6(-0.325,-3.491) 7(0.325,-3.491) 8(0.975,-3.491) 9(1.625,-3.491) 10(2.275,-3.491) 11(2.925,-3.491) 12(3.575,-3.491) 13(3.575,3.491) 14(2.925,3.491) 15(2.275,3.491) 16(1.625,3.491) 17(0.975,3.491) 18(0.325,3.491) 19(-0.325,3.491) 20(-0.975,3.491) 21(-1.625,3.491) 22(-2.275,3.491) 23(-2.925,3.491) 24(-3.575,3.491)
SW-TH_2P-L15.0-W10.5-P5.00_KCD11-2P-R
  oval 1.6x5 hole 0.8x4: 1(-2.5,0) 2(2.5,0)
TO-263-5_L10.1-W8.7-P1.70-LS15.2-BR
  rect 3.358x1.02 smd: 1(5.183,-3.4) 2(5.183,-1.7) 3(5.183,0) 4(5.183,1.7) 5(5.183,3.4)
  rect 9x11 smd: 6(-5.184,0)
USB-C-SMD_TYPE-C-6PIN-2MD-073
  rect 0.6x1.1 smd: 1(-3.2,2.375) 2(-2.4,2.375) 11(2.4,2.375) 12(3.2,2.375)
  rect 0.3x1.1 smd: 3(-1.75,2.375) 4(-1.25,2.375) 5(-0.75,2.375) 6(-0.25,2.375) 7(0.25,2.375) 8(0.75,2.375) 9(1.25,2.375) 10(1.75,2.375)
  oval 1.2x2 hole 0.6x1.5: 13(-4.325,1.825) 14(4.325,1.825)
  oval 1.2x1.8 hole 0.6x1.2: 13(-4.325,-2.375) 14(4.325,-2.375)

## Nets
As in the schematic.

Pads without a net: LDO1 4; USB1 3 9

## Via types
v1: diameter 0.61, hole 0.305, Top Layer to Bottom Layer, 66 vias

## Routing (per net, layer and track width the routed paths; a pad name or vN(x,y) marks a point on that pad's centre or on a via; arc(x,y) is an arc through that point)
3V3: length 125.3
  Top Layer w0.254: U1.48 27.94,45.64 27.94,46.48 v1(27.68,46.73) ; U1.36 23.92,50.16 v1(24.25,50.16) ; U1.9 31.58,48.15 31.58,48.8 31.27,49.11 30.44,49.11 30.19,48.86 v1(29.62,48.86) ; v1(28.57,53.84) 28.57,54.05 U1.24
  Top Layer w0.762: H3.1 31.28,61.72 26.28,61.72 25.01,60.45 v1(23.49,60.45)
  Bottom Layer w0.254: C21.2 27.3,47.11 v1(27.68,46.73) ; v1(24.25,50.16) 23.11,50.16 21.33,51.94 21.33,52.52 C18.2
  Bottom Layer w0.381: R11.2 27.76,70.35 H2.3
  Bottom Layer w0.508: 20.82,32.81 20.88,32.76 25.27,32.76 25.68,32.34 R12.2 ; H1.4 25.68,29.24 R12.2 ; C19.2 29.58,54.85 v1(28.57,53.84) 28.75,53.66 C20.2 29.2,49.27 v1(29.62,48.86) ; R12.2 25.72,31.62 C22.2
  Bottom Layer w0.762: C20.2 28.7,49.22 28.7,48.78 28.04,48.12 25.52,48.12 ; H5.1 16.38,27.17 20.82,31.62 20.82,48.12 ; H2.3 39.37,68.32 39.37,62.73 38.3,61.67 H4.1 34.24,61.71 H3.1 ; 20.82,48.12 25.52,48.12 ; 20.82,48.12 20.06,48.88 20.06,51.86 C18.2 19.68,54.17 19.68,57.96 LDO1.5 ; 25.52,48.12 25.52,47.16 C21.2
5V: length 219.5
  Top Layer w0.254: U4.20 U4.19 ; v1(24.82,62.46) 23.62,62.46 23.36,62.72 v1(23.36,72.39) ; U5.19 U5.20
  Top Layer w0.508: 25.66,72.39 USB1.11 ; 25.66,72.39 29.97,72.39 30.46,72.88 USB1.2 ; 25.66,72.39 v1(24.42,72.39) v1(23.36,72.39) 22.47,73.27 22.47,74.67 20.31,76.83 13.71,76.83 12.57,75.69 12.57,34.03 H5.3
  Top Layer w0.762: H5.3 12.69,30.6 12.69,26.27 17.97,21 U6.4 ; 54.59,67.81 54.86,67.54 v1(54.86,66.04) ; v1(54.73,43.94) 54.74,43.95 54.74,49.46 ; v1(17.9,15.24) 22.65,10.49 C6.2 45.08,25.14 v1(55.37,35.43) ; C4.2 59.8,72.51 v1(58.54,72.51) ; v1(56.51,54.73) 60.25,54.73 C38.2
  Bottom Layer w0.254: LDO1.3 24.82,62.48
  Bottom Layer w0.762: 58.54,66.04 62.64,61.94 62.64,58.83 62.1,58.29 60.07,58.29 v1(56.51,54.73) 54.73,52.95 v1(54.73,43.94) 55.37,43.3 v1(55.37,35.43) ; 58.54,66.04 v1(58.54,72.51) ; 58.54,66.04 v1(54.86,66.04) ; v1(17.9,15.24) 17.9,20.44 U6.4
GND: length 10.2
  Top Layer w0.254: U1.35 22.85,51.94 v1(22.35,51.94) ; v1(31.11,56.26) 31.11,55.88 U1.23 ; U4.4 U4.3 ; U5.10 U5.9 ; U4.9 U4.10 ; U5.4 U5.3
  Bottom Layer w0.254: 30.44,55.73 30.59,55.73 v1(31.11,56.26)
  Bottom Layer w0.508: C24.1 24.14,59.61 C16.1 ; C18.1 22.35,52.37 v1(22.35,51.94)
  vias: v1(21.74,49.76) v1(22.09,58.8) v1(24.63,68.45) v1(24.97,58.6) v1(52.26,76.52) v1(54.22,40.64) v1(56.34,76.58)
VBAT: length 45.3
  Top Layer w0.254: H2.20 43.56,29.33 v1(43.56,51.31) ; U1.1 28.49,45.59 28.49,48.56 30.22,50.29 v1(30.92,50.29)
  Bottom Layer w0.254: v1(30.92,50.29) 38.73,50.29 39.76,51.31 v1(43.56,51.31)
VCC: length 76.8
  Top Layer w0.254: C35.2 58.98,67.81 U4.24 57.78,67.81 57.78,69.34 57.27,69.84 52.14,69.84 51.56,69.26 ; 60.28,51.05 58.69,49.46 U5.24 57.93,50.78 57.65,51.05 51.81,51.05 51.68,50.92 ; 51.56,69.26 51.28,68.98 U4.14 ; 51.56,69.26 50.92,69.26 50.62,68.96 50.62,67.82 U4.13 ; 51.68,50.92 51.18,50.92 50.78,50.52 U5.13 ; 51.68,50.92 51.43,50.66 U5.14
  Top Layer w0.762: 60.28,51.05 63.27,51.05 64.22,52 ; 64.22,52 64.22,39.8 SW2.1 ; 64.22,52 66.29,54.07 66.29,67.75 C1.1 62.31,68.57 C35.2
AO1_1: length 4.4
  Top Layer w0.254: U4.2 U4.1
  Top Layer w0.508: U4.1 57.89,74.9 CN1.1
AO1_2: length 4.5
  Top Layer w0.254: U4.6 U4.5
  Top Layer w0.508: CN1.2 55.32,78.48 55.18,78.33 U4.5
AO2_1: length 5.9
  Top Layer w0.254: U5.2 U5.1
  Top Layer w0.508: U5.1 57.93,58.2 CN3.1
AO2_2: length 6
  Top Layer w0.254: U5.5 U5.6
  Top Layer w0.508: U5.5 55.33,58.1 CN3.2
BO1_1: length 4.7
  Top Layer w0.254: U4.11 U4.12
  Top Layer w0.508: U4.12 49.78,75.64 49.78,78.46 CN2.1
BO1_2: length 13.5
  Top Layer w0.254: U4.7 U4.8
  Top Layer w0.508: U4.7 53.88,73.31 53.59,73.02 48.64,73.02 47.24,74.42 47.24,78.46 CN2.2
BO2_1: length 5.4
  Top Layer w0.254: U5.12 U5.11
  Top Layer w0.508: CN4.1 52.43,59.67 51.43,58.67 U5.11
BO2_2: length 11.3
  Top Layer w0.254: U5.8 U5.7
  Top Layer w0.508: CN4.2 49.91,60.81 49.91,55.37 50.54,54.73 52.95,54.73 53.38,55.15 U5.8
BOOT0: length 20.3
  Top Layer w0.254: U1.44 26.21,46.74 26.21,46.87 28.01,48.67 28.01,49.02 v1(29.46,50.47)
  Bottom Layer w0.254: R16.2 29.66,58.8 29.71,58.85 29.71,59.43 30.22,59.94 32.13,59.94 32.76,59.3 32.76,54.86 29.92,52.01 29.92,50.92 v1(29.46,50.47)
BOOT1: length 11.6
  Top Layer w0.254: U1.20 29.92,52.57 v1(29.46,52.57)
  Bottom Layer w0.254: v1(29.46,52.57) 32.25,55.37 32.25,58.03 31.87,58.42 30.97,58.42 30.8,58.25 30.4,58.25 29.51,57.35 29.51,57.27
NRST: length 43
  Top Layer w0.254: H2.4 41.4,66.94 38.02,63.56 38.02,58.42 36.75,57.15 v1(33.4,57.15) v1(25.65,57.15) 27.43,58.92 SW1.2 ; v1(30.48,47.68) 30.64,47.68 31.37,46.95
  Bottom Layer w0.254: C17.2 R14.1 25.14,56.64 v1(25.65,57.15) ; v1(30.48,47.68) 30.27,47.89 30.27,51.87 33.4,54.99 v1(33.4,57.15)
OSC32_IN: length 31.5
  Top Layer w0.254: H2.18 37.97,35.68 v1(37.97,41.91) ; U1.3 30.45,45.04 v1(30.45,44.17) 28.82,42.54 26.34,42.54 C27.2 25.19,38.79 X5.1
  Bottom Layer w0.254: v1(30.45,44.17) 30.5,44.12 36.51,44.12 37.97,42.67 v1(37.97,41.91)
OSC32_OUT: length 28.8
  Top Layer w0.254: H2.17 38.7,37.49 v1(38.7,42.54) ; 30.31,45.89 30.31,45.88 31.12,45.07 v1(31.12,44.71) 31.12,43.95 29.36,42.18 27.29,42.18 26.59,41.48 C28.2 26.59,38.56 X5.2
  Bottom Layer w0.254: v1(38.7,42.54) 36.54,44.71 v1(31.12,44.71)
OSC_IN: length 10.3
  Top Layer w0.254: X3.1 30.99,38.45 30.99,39.94 30.6,40.32 C34.1 31.84,42.6 31.84,45.06 U1.5
OSC_OUT: length 7.8
  Top Layer w0.254: X3.3 32.21,41.28 ; U1.6 32.2,45.41 C33.2 ; 32.26,41.33 32.33,41.4
PA0/AIN1_1: length 62.7
  Top Layer w0.254: v1(55.88,65.15) 55.88,67.76 U4.21 ; U1.10 33.33,47.11 38.23,47.11 39.29,46.06 39.29,39.44 H2.16
  Bottom Layer w0.254: H2.16 47.21,43.15 47.21,61.7 48.5,62.99 58.16,62.99 58.41,63.24 58.41,64.64 57.91,65.15 v1(55.88,65.15)
PA1/AIN1_2: length 53.9
  Top Layer w0.254: H2.15 39.64,41.63 39.64,46.2 38.38,47.47 33.67,47.47 33.4,47.75 33.4,47.75 32.78,48.37 ; v1(56.51,64) 56.51,67.77 U4.22
  Bottom Layer w0.254: H2.15 46.43,44.9 46.43,62.18 48.25,64 v1(56.51,64)
PA2: length 12.4
  Top Layer w0.254: U1.12 37.63,48.72 40,46.35 40,43.81 H2.14
PA3: length 11.1
  Top Layer w0.254: U1.13 36.15,50.84 41.4,45.59 H2.13
PA4/BIN1_1: length 39.2
  Top Layer w0.254: 32.78,51.19 33.28,51.69 35.8,51.69 40,47.49 H2.12 ; v1(53.21,64.64) 53.23,64.66 U4.17
  Bottom Layer w0.254: H2.12 42.35,47.49 46.07,51.21 46.07,62.33 48.38,64.64 v1(53.21,64.64)
PA5/BIN1_2: length 36.2
  Top Layer w0.254: H2.11 37.96,50.03 35.95,52.04 32.93,52.04 U1.15 ; v1(52.57,65.27) 52.57,67.8 U4.16
  Bottom Layer w0.254: H2.11 43.81,50.03 45.72,51.94 45.72,62.48 48.51,65.27 v1(52.57,65.27)
PA6: length 9.6
  Top Layer w0.254: H2.10 41.22,52.4 32.58,52.4 U1.16
PA7: length 10.9
  Top Layer w0.254: H2.9 39.04,52.76 32.23,52.76 31.72,52.25
PA8: length 19.1
  Top Layer w0.254: 25.67,53.31 U1.29 22.49,56.54 18.33,56.54 16.71,58.16 16.71,62.04 14.35,64.4 H5.16
PA9/USART1_TX: length 85.2
  Top Layer w0.254: U1.30 22.14,56.18 18.19,56.18 16.35,58.01 16.35,60.73 H5.15 ; v1(10.41,62.73) 10.41,49.02 9.27,47.87 9.27,47.81 9.16,47.7 9.16,21.83 14.42,16.58 22.21,16.58 22.74,16.05 23.22,16.05 23.57,16.39 25.64,16.39 v1(25.65,16.38)
  Bottom Layer w0.254: H5.15 v1(10.41,62.73) ; v1(25.65,16.38) 25.65,20.44 U6.1
PA10/USART1_RX: length 75.9
  Top Layer w0.254: v1(11.14,60.19) 11.14,49.18 9.52,47.56 9.52,21.98 14.56,16.94 22.68,16.94 v1(22.98,16.63) ; H5.14 16,58.54 16,57.87 18.04,55.83 21.79,55.83 U1.31
  Bottom Layer w0.254: U6.2 22.98,20.44 v1(22.98,16.63) ; H5.14 v1(11.14,60.19)
PA13/SWDIO: length 47.8
  Top Layer w0.254: H1.3 27.68,28.95 26.66,29.97 18.92,29.97 15.27,33.61 13.86,33.61 13.08,34.4 13.08,52.97 13.86,53.75 21.74,53.75 U1.34
PA14/SWCLK: length 64.9
  Top Layer w0.254: H1.2 33.01,25.9 41.78,25.9 41.87,25.99 41.89,25.99 44.41,28.52 v1(44.41,53.75) ; v1(30.98,51.05) 26.16,51.05 24.51,49.4 23.92,49.4 U1.37
  Bottom Layer w0.254: v1(30.98,51.05) 37.71,51.05 40.42,53.75 v1(44.41,53.75)
PA15/1_PWMA: length 100.6
  Top Layer w0.254: v1(57.02,69.21) 57.13,69.1 U4.23 ; H5.11 14.35,51.7 15.52,50.52 15.52,49.36 17.57,47.32 22.54,47.32 U1.38
  Bottom Layer w0.254: H5.11 14.35,51.7 15.52,50.52 15.52,49.54 14.74,48.76 11.93,48.76 9.27,51.43 9.27,73.52 13.18,77.44 42.94,77.44 51.17,69.21 v1(57.02,69.21)
PB0/AIN2_1: length 37.5
  Top Layer w0.254: v1(56,47.11) 56,49.44 U5.21 ; 31.37,52.61 31.88,53.11 38.89,53.11 40.13,54.35 40.13,56.38 H2.8 45.97,57.65 51.68,51.94 v1(56,51.94)
  Bottom Layer w0.254: v1(56,51.94) v1(56,47.11)
PB1/AIN2_2: length 40.4
  Top Layer w0.254: U5.22 56.64,49.45 v1(56.64,47.87) ; v1(56.64,52.57) 51.55,52.57 43.93,60.19 H2.7 39.77,58.57 39.77,54.49 38.75,53.47 31.53,53.47 U1.19
  Bottom Layer w0.254: v1(56.64,52.57) v1(56.64,47.87)
PB3/1_PWMB: length 87.4
  Top Layer w0.254: U1.39 22.89,46.96 17.42,46.96 H5.10 ; v1(51.94,66.29) 51.94,67.8 U4.15
  Bottom Layer w0.254: v1(51.94,66.29) 51.94,67.94 42.79,77.08 13.33,77.08 9.62,73.38 9.62,54.76 H5.10
PB4/2_PWMA: length 108.4
  Top Layer w0.254: U5.23 57.26,49.45 57.26,39.86 34.69,17.29 14.71,17.29 10.28,21.72 v1(10.28,47.49) ; U1.40 23.25,46.6 15.23,46.6 H5.9
  Bottom Layer w0.254: H5.9 v1(10.28,47.49)
PB5/2_PWMB: length 103.6
  Top Layer w0.254: 24.65,47.3 22.3,44.95 H5.8 ; v1(52.06,47.37) 52.06,49.45 U5.15
  Bottom Layer w0.254: H5.8 12.19,42.79 12.19,18.54 16.38,14.35 32,14.35 52.06,34.41 v1(52.06,47.37)
PB6: length 12.5
  Top Layer w0.254: U1.42 20.47,42.41 H5.7
PB7: length 13.8
  Top Layer w0.254: H5.6 18.64,39.87 U1.43
PB8: length 15.8
  Top Layer w0.254: H5.5 18.44,37.33 19.58,38.48 19.58,39.4 26.07,45.89
PB9: length 18.1
  Top Layer w0.254: U1.46 19.93,39.05 19.93,36.44 18.28,34.79 H5.4
PB10: length 17.6
  Top Layer w0.254: 30.31,53.67 30.87,54.22 37.59,54.22 38.73,55.37 38.73,60.07 H2.6
PB11: length 20
  Top Layer w0.254: H2.5 40.13,64 40.13,61.97 38.37,60.21 38.37,55.51 37.44,54.58 30.51,54.58 U1.22
PB12/BIN2_1: length 149.2
  Top Layer w0.254: U5.17 53.38,36.48 34.55,17.65 14.86,17.65 11.73,20.78 11.73,71.32 v1(11.23,71.81) ; H5.20 14.35,74.56 18.13,70.77 18.13,58.83 19,57.96 23.9,57.96 U1.25
  Bottom Layer w0.254: v1(11.23,71.81) 11.22,71.83 11.22,73.14 13.52,75.43 H5.20
PB13/BIN2_2: length 143.6
  Top Layer w0.254: H5.19 14.35,72.02 17.78,68.59 17.78,58.6 18.78,57.61 23.54,57.61 26.78,54.38 ; v1(11.81,72.89) 12.08,72.61 12.08,20.93 14.98,18.03 34.42,18.03 52.73,36.33 U5.16
  Bottom Layer w0.254: H5.19 v1(11.81,72.89)
PB14: length 24
  Top Layer w0.254: U1.27 23.19,57.25 18.63,57.25 17.42,58.46 17.42,66.41 14.35,69.48 H5.18
PB15: length 21.6
  Top Layer w0.254: H5.17 14.35,66.94 17.06,64.22 17.06,58.31 18.48,56.89 22.84,56.89 26.07,53.67
PC13: length 47.3
  Top Layer w0.254: H2.19 42.79,31.11 v1(42.79,48.76) ; v1(30.95,48.48) 30.12,48.48 29.38,47.73 29.38,46.42 29.11,46.14 29.11,45.68 U1.2
  Bottom Layer w0.254: R13.2 31.66,30.81 32,30.48 40.63,30.48 H2.19 ; v1(30.95,48.48) 31.15,48.67 42.7,48.67 v1(42.79,48.76)
USB_D+_PA12: length 50.4
  Top Layer w0.254: USB1.6 28.32,73.94 28.32,73.34 28.09,73.12 27.52,73.12 27.31,73.32 USB1.8 27.31,74.66 v1(26.92,75.05) ; v1(25.01,50.92) 25.01,51.19 U1.33 21.09,55.11 H5.12
  Bottom Layer w0.254: 26.11,72 26.11,72.43 26.66,72.99 29.11,72.99 29.65,73.53 29.65,75.94 29.14,76.45 27.3,76.45 26.94,76.09 26.94,75.08 v1(26.92,75.05) ; 26.11,72 26.16,72.06 R11.1 ; 26.11,72 26.11,58.08 26.64,57.55 26.64,51.85 25.76,50.97 25.06,50.97 v1(25.01,50.92)
USB_D-_PA11: length 47.2
  Top Layer w0.254: v1(25.52,51.56) 25.35,51.56 21.44,55.47 17.89,55.47 15.71,57.65 H5.13 ; USB1.5 28.81,75.06 28.57,75.31 28.06,75.31 v1(27.81,75.06) USB1.7
  Bottom Layer w0.254: v1(25.52,51.56) 26.28,52.32 26.28,57.4 25.75,57.93 25.75,72.58 26.52,73.34 28.96,73.34 29.29,73.68 29.29,75.79 29.01,76.07 28.13,76.07 27.81,75.75 v1(27.81,75.06)
$1N1914: length 14.5
  Top Layer w0.254: v1(30.47,71.67) 30.47,71.88 31.36,72.77 33.01,72.77 33.58,73.34 33.58,75.63 32.61,76.6 29.83,76.6 29.31,76.08 USB1.4
  Bottom Layer w0.254: R10.1 30.09,72.06 v1(30.47,71.67)
$1N1923: length 15.7
  Top Layer w0.254: USB1.10 26.31,76.45 26.82,76.96 32.76,76.96 33.94,75.78 33.94,72.47 v1(33.52,72.06)
  Bottom Layer w0.254: R9.1 v1(33.52,72.06)
$1N1934: length 3.7
  Top Layer w0.254: v1(24,31.58) 24.65,32.23 LED1.2
  Bottom Layer w0.254: R12.1 v1(24,31.58)
$1N1936: length 3.5
  Top Layer w0.254: v1(33.27,31.58) 33.27,33.76 LED2.2
  Bottom Layer w0.254: R13.1 v1(33.27,31.58)
$1N1947: length 7.5
  Top Layer w0.254: H3.2 31.5,64.25 32.76,62.99 32.76,60.57 v1(31.49,59.3)
  Bottom Layer w0.254: R16.1 30.91,59.3 v1(31.49,59.3)
$1N2133: length 11.1
  Top Layer w0.254: H4.2 35.81,62.68 35.81,60.57 32.96,57.73 v1(31.49,57.73)
  Bottom Layer w0.254: R15.2 31.03,57.27 v1(31.49,57.73)

## Copper pours and planes (outline as drawn; the poured copper is in the pictures)
3V3 on Bottom Layer: 23.1,62.05 23.81,61.33 23.81,56.45 23.49,56.13 23.02,56.13 22.8,56.35 22.8,59.99 22.47,60.32 22.47,61.76 22.76,62.05
5V on Top Layer: 57.91,16.89 58.29,17.27 59.18,17.27 59.56,16.89 59.56,11.3 58.29,10.03 52.32,10.03 51.43,9.14 44.44,9.14 43.56,10.03 43.56,14.47 46.1,17.01 52.06,17.01 55.76,13.32 57.51,13.32 57.91,13.71
5V on Bottom Layer: 23.36,72.89 24.63,72.89 24.89,72.64 24.89,72.13 23.49,70.73 23.49,62.99 23.24,62.73 22.73,62.73 22.47,62.99 22.47,72
GND on Top Layer: 33.12,75.39 33.12,73.76 32.63,73.27 30.98,73.27 30.86,73.4 30.86,74.42 30.98,74.54 31.38,74.54 31.62,74.78 31.62,75.43 31.87,75.69 32.82,75.69
GND on Top Layer: 7,80 73,80 80,73 80,7 73,0 7,0 0,7 0,73 6.98,79.98 6.98,80.01
GND on Top Layer: 59.03,70.35 59.34,70.66 61.01,70.66 61.34,70.99 61.34,73.02 61.08,73.27 59.36,73.27 59.12,73.52 59.12,74.54 59.41,74.82 64.49,74.82 64.89,74.42 64.89,72.26 64.51,71.88 63.33,71.88 62.73,71.28 62.73,70.48 61.52,69.27 59.31,69.27 59.03,69.55 59.03,70.33 59.05,70.35
GND on Top Layer: 59.57,56.54 59.88,56.85 64.55,56.85 65.15,56.26 65.15,54.48 64.64,53.97 63.75,53.97 61.59,51.81 59.78,51.81 59.57,52.03 59.57,52.83 60.07,53.33 61.21,53.33 61.46,53.59 61.46,55.11 61.21,55.37 59.95,55.37 59.57,55.74
GND on Top Layer: 43.94,8.76 44.44,9.27 45.81,9.27 46.06,9.01 51.68,9.01 52.32,9.65 52.32,9.77 58.8,9.77 59.69,10.66 59.69,17.29 59.43,17.54 57.92,17.54 57.65,17.27 57.65,13.71 57.4,13.46 56.64,13.46 56.38,13.71 56.38,17.65 55.88,18.16 55.88,20.44 56.13,20.7 59.94,20.7 60.19,20.44 60.19,18.28 61.21,17.27 61.21,13.56 61.74,13.03 64.98,13.03 65.78,13.84 67.69,13.84 69.46,15.62 69.46,22.6 71.12,24.25 73.11,24.25 74.76,22.6 74.76,16.98 67.31,9.52 67.31,1.52 66.03,0.25 50.29,0.25 43.94,6.6
GND on Bottom Layer: 7,80 73,80 80,73 80,7 73,0 6.98,0 6.98,0 0,6.97 0,73
VCC on Top Layer: 60.07,38.35 60.95,37.46 60.95,31.36 68.45,23.87 68.45,15.07 67.47,14.09 65.78,14.09 65.15,13.46 63.5,13.46 63.11,13.84 63.11,16.89 63.88,17.65 63.88,22.6 57.91,28.57 57.91,37.46 58.8,38.35
$1N2477 on Top Layer: 62.53,13.32 62.86,13.65 62.86,21.97 58.03,26.79 48.64,26.79 47.87,26.03 47.87,23.11 48.64,22.35 58.44,22.35 60.45,20.33 60.45,18.44 61.35,17.54 61.35,13.71 61.74,13.32
$1N2684 on Top Layer: 62.73,36.83 64.12,38.21 70.24,38.21 72.89,35.56 76.7,35.56 77.08,35.17 77.08,32.76 76.32,32 63.88,32 62.73,33.14
